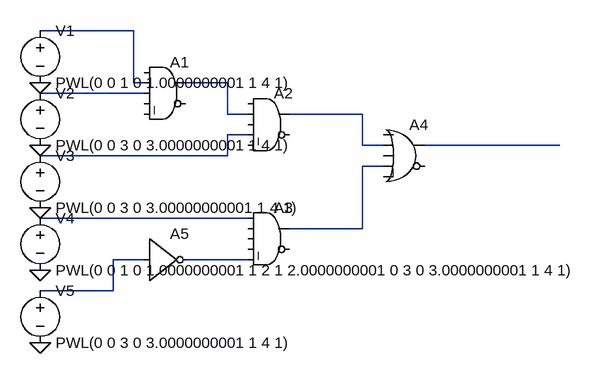
[diagram p0: schematic ques_47.asc]
ques_47.asc, the LTspice schematic file:
Version 4.1
SHEET 1 916 680
WIRE 160 0 16 0
WIRE 160 80 160 0
WIRE 176 80 160 80
WIRE 304 80 240 80
WIRE 176 96 16 96
WIRE 304 128 304 80
WIRE 336 128 304 128
WIRE 512 128 400 128
WIRE 336 160 304 160
WIRE 512 176 512 128
WIRE 544 176 512 176
WIRE 816 176 608 176
WIRE 304 192 304 160
WIRE 304 192 16 192
WIRE 544 208 512 208
WIRE 336 288 16 288
WIRE 512 304 512 208
WIRE 512 304 400 304
WIRE 176 352 128 352
WIRE 336 352 240 352
WIRE 128 400 128 352
WIRE 128 400 16 400
FLAG 16 80 0
FLAG 16 176 0
FLAG 16 272 0
FLAG 16 368 0
FLAG 16 480 0
SYMBOL Digital\\and 208 32 R0
SYMATTR InstName A1
SYMBOL Digital\\and 368 80 R0
SYMATTR InstName A2
SYMBOL Digital\\and 368 256 R0
SYMATTR InstName A3
SYMBOL Digital\\or 576 128 R0
SYMATTR InstName A4
SYMBOL Digital\\inv 176 288 R0
SYMATTR InstName A5
SYMBOL voltage 16 -16 R0
WINDOW 123 0 0 Left 0
WINDOW 39 0 0 Left 0
SYMATTR InstName V1
SYMATTR Value PWL(0 0 1 0 1.0000000001 1 4 1)
SYMBOL voltage 16 80 R0
WINDOW 123 0 0 Left 0
WINDOW 39 0 0 Left 0
SYMATTR InstName V2
SYMATTR Value PWL(0 0 3 0 3.0000000001 1 4 1)
SYMBOL voltage 16 176 R0
WINDOW 123 0 0 Left 0
WINDOW 39 0 0 Left 0
SYMATTR InstName V3
SYMATTR Value PWL(0 0 3 0 3.00000000001 1 4 1)
SYMBOL voltage 16 272 R0
WINDOW 123 0 0 Left 0
WINDOW 39 0 0 Left 0
SYMATTR InstName V4
SYMATTR Value PWL(0 0 1 0 1.0000000001 1 2 1 2.0000000001 0 3 0 3.0000000001 1 4 1)
SYMBOL voltage 16 384 R0
WINDOW 123 0 0 Left 0
WINDOW 39 0 0 Left 0
SYMATTR InstName V5
SYMATTR Value PWL(0 0 3 0 3.0000000001 1 4 1)

The netlist it stands for:
* ques_47.asc
A1 0 N001 N003 0 0 0 N002 0 AND
A2 0 N002 0 N005 0 0 N004 0 AND
A3 N008 0 0 0 N010 0 N007 0 AND
A4 0 N004 0 N007 0 0 N006 0 OR
A5 N009 0 0 0 0 N010 0 0 BUF
V1 N001 0 PWL(0 0 1 0 1.0000000001 1 4 1)
V2 N003 0 PWL(0 0 3 0 3.0000000001 1 4 1)
V3 N005 0 PWL(0 0 3 0 3.00000000001 1 4 1)
V4 N008 0 PWL(0 0 1 0 1.0000000001 1 2 1 2.0000000001 0 3 0 3.0000000001 1 4 1)
V5 N009 0 PWL(0 0 3 0 3.0000000001 1 4 1)
.backanno
.end